# Altium schematic sheet INPUTS_GATES_A.SchDoc
size A4; SheetNumber: 5; SheetTotal: 6
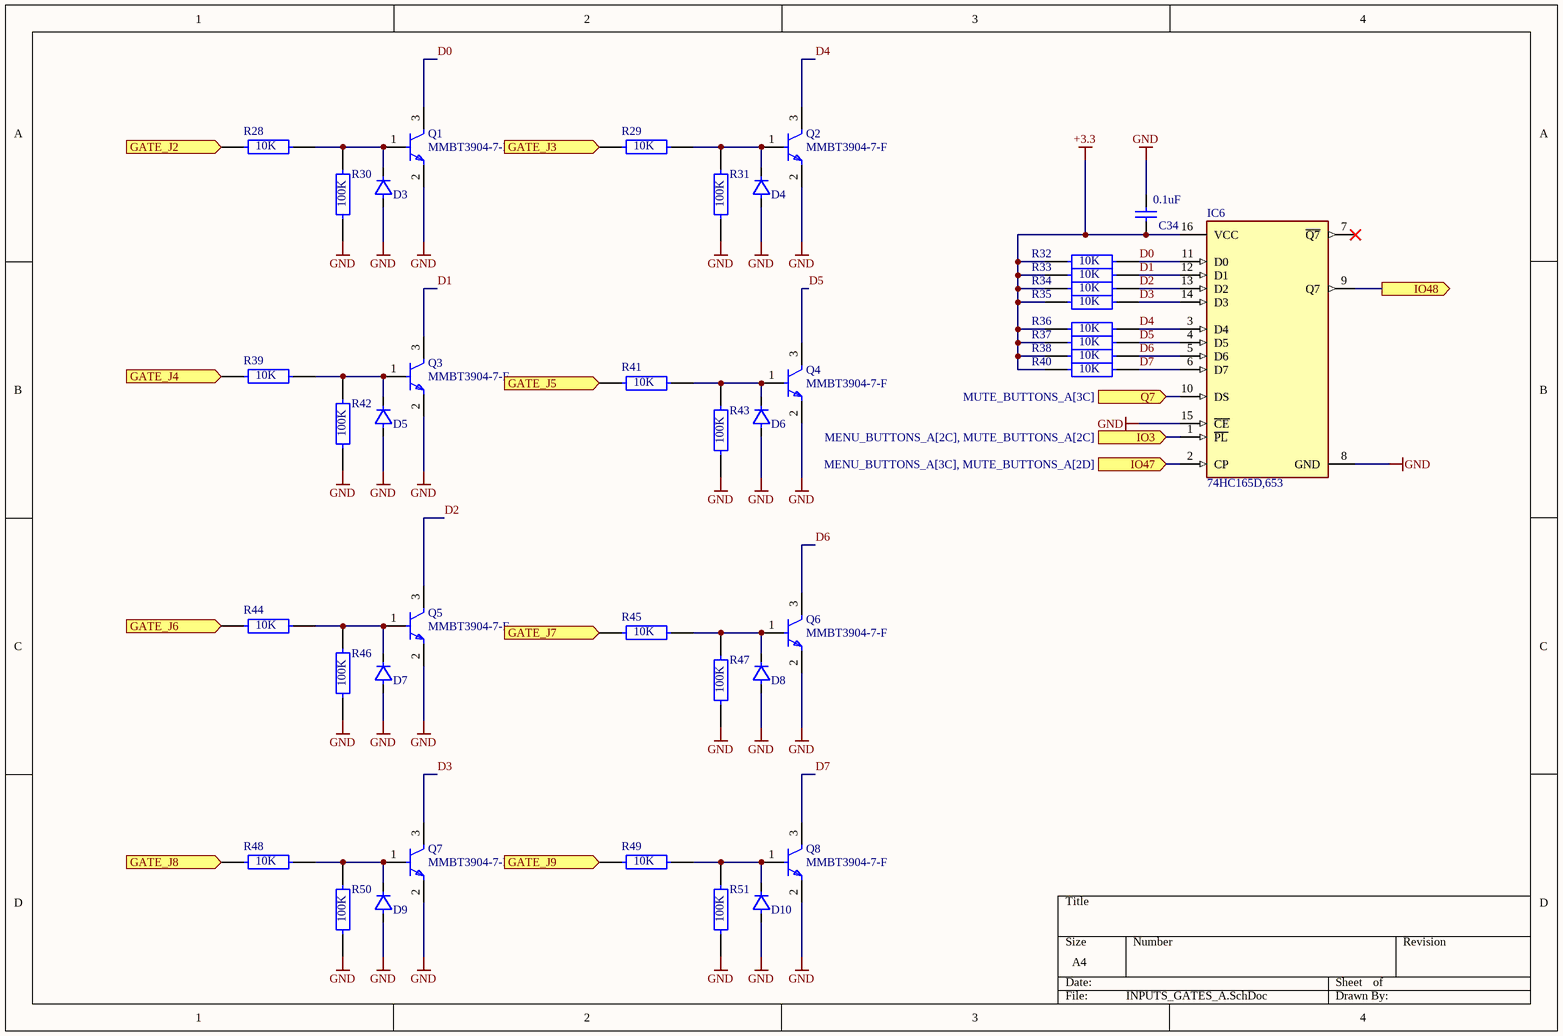
[diagram p0: INPUTS_GATES_A.SchDoc]

## Parts
C34  0.1uF  [CAPC2013X145X48NL20T23]
D3  1N4148WS  [4148]  (value not drawn)
D4  1N4148WS  [4148]  (value not drawn)
D5  1N4148WS  [4148]  (value not drawn)
D6  1N4148WS  [4148]  (value not drawn)
D7  1N4148WS  [4148]  (value not drawn)
D8  1N4148WS  [4148]  (value not drawn)
D9  1N4148WS  [4148]  (value not drawn)
D10  1N4148WS  [4148]  (value not drawn)
IC6  74HC165D,653  [FP-SOT109-1-MFG]
Q1  MMBT3904-7-F  [3904-SOT23]
Q2  MMBT3904-7-F  [3904-SOT23]
Q3  MMBT3904-7-F  [3904-SOT23]
Q4  MMBT3904-7-F  [3904-SOT23]
Q5  MMBT3904-7-F  [3904-SOT23]
Q6  MMBT3904-7-F  [3904-SOT23]
Q7  MMBT3904-7-F  [3904-SOT23]
Q8  MMBT3904-7-F  [3904-SOT23]
R28  10K  [FP-RN73R2A-IPC_A]
R29  10K  [FP-RN73R2A-IPC_A]
R30  100K  [FP-RN73R2A-IPC_A]
R31  100K  [FP-RN73R2A-IPC_A]
R32  10K  [FP-RN73R2A-IPC_A]
R33  10K  [FP-RN73R2A-IPC_A]
R34  10K  [FP-RN73R2A-IPC_A]
R35  10K  [FP-RN73R2A-IPC_A]
R36  10K  [FP-RN73R2A-IPC_A]
R37  10K  [FP-RN73R2A-IPC_A]
R38  10K  [FP-RN73R2A-IPC_A]
R39  10K  [FP-RN73R2A-IPC_A]
R40  10K  [FP-RN73R2A-IPC_A]
R41  10K  [FP-RN73R2A-IPC_A]
R42  100K  [FP-RN73R2A-IPC_A]
R43  100K  [FP-RN73R2A-IPC_A]
R44  10K  [FP-RN73R2A-IPC_A]
R45  10K  [FP-RN73R2A-IPC_A]
R46  100K  [FP-RN73R2A-IPC_A]
R47  100K  [FP-RN73R2A-IPC_A]
R48  10K  [FP-RN73R2A-IPC_A]
R49  10K  [FP-RN73R2A-IPC_A]
R50  100K  [FP-RN73R2A-IPC_A]
R51  100K  [FP-RN73R2A-IPC_A]

## Ports
GATE_J2, GATE_J3, GATE_J4, GATE_J5, GATE_J6, GATE_J7, GATE_J8, GATE_J9, IO3 (in, see MENU_BUTTONS_A[2C], MUTE_BUTTONS_A[2C]), IO47 (in, see MENU_BUTTONS_A[3C], MUTE_BUTTONS_A[2D]), IO48 (out), Q7 (in, see MUTE_BUTTONS_A[3C])

## Nets
+3.3: C34.1 IC6.16(VCC) R32.1 R33.1 R34.1 R35.1 R36.1 R37.1 R38.1 R40.1
GND: C34.2 D3.2(A) D4.2(A) D5.2(A) D6.2(A) D7.2(A) D8.2(A) D9.2(A) D10.2(A) IC6.8(GND) IC6.15(~{CE}) Q1.2(E) Q2.2(E) Q3.2(E) Q4.2(E) Q5.2(E) Q6.2(E) Q7.2(E) Q8.2(E) R30.1 R31.1 R42.1 R43.1 R46.1 R47.1 R50.1 R51.1
D0: IC6.11(D0) Q1.3(C) R32.2
D1: IC6.12(D1) Q3.3(C) R33.2
D2: IC6.13(D2) Q5.3(C) R34.2
D3: IC6.14(D3) Q7.3(C) R35.2
D4: IC6.3(D4) Q2.3(C) R36.2
D5: IC6.4(D5) Q4.3(C) R37.2
D6: IC6.5(D6) Q6.3(C) R38.2
D7: IC6.6(D7) Q8.3(C) R40.2
GATE_J2: R28.1 ; port GATE_J2
GATE_J3: R29.1 ; port GATE_J3
GATE_J4: R39.1 ; port GATE_J4
GATE_J5: R41.1 ; port GATE_J5
GATE_J6: R44.1 ; port GATE_J6
GATE_J7: R45.1 ; port GATE_J7
GATE_J8: R48.1 ; port GATE_J8
GATE_J9: R49.1 ; port GATE_J9
IO3: IC6.1(~{PL}) ; port IO3
IO47: IC6.2(CP) ; port IO47
IO48: IC6.9(Q7) ; port IO48
Q7: IC6.10(DS) ; port Q7
NetD3_1: D3.1(C) Q1.1(B) R28.2 R30.2
NetD4_1: D4.1(C) Q2.1(B) R29.2 R31.2
NetD5_1: D5.1(C) Q3.1(B) R39.2 R42.2
NetD6_1: D6.1(C) Q4.1(B) R41.2 R43.2
NetD7_1: D7.1(C) Q5.1(B) R44.2 R46.2
NetD8_1: D8.1(C) Q6.1(B) R45.2 R47.2
NetD9_1: D9.1(C) Q7.1(B) R48.2 R50.2
NetD10_1: D10.1(C) Q8.1(B) R49.2 R51.2

Not connected (* = marked no-connect by the designer): IC6 7(~{Q7})*

## Library data of the parts
C34 = CAP: Manufacturer: Vitramon; Part Number: VJ0805Y682KXAMT
D3-D10 = 4148WS: DIODE GEN PURP 75V 150MA SOD323F; Forward Voltage: 1V; Power Dissipation: 200mW; Element Configuration: Single; Max Forward Surge Current (Ifsm): 2A; Peak Reverse Current: 5uA; Recovery Time: 4ns; Package Quantity: 1; Number of Pins: 2; Height: 1mm; REACH SVHC: No SVHC; Max Reverse Voltage (DC): 75V; Forward Current: 150mA; Length: 1.8mm; Max Repetitive Reverse Voltage (Vrrm): 75V; Max Operating Temperature: 150°C; Average Rectified Current: 150mA; Contact Plating: Tin; Packaging: Tape and Reel; Radiation Hardening: No; Min Operating Temperature: -55°C; Width: 1.35mm; Weight: 0.0276g; Lead Free: Lead Free; Mount: Surface Mount; Reverse Voltage: 75V; Reverse Recovery Time: 4ns
IC6 = 74HC165: IC SHIFT REGST 8BIT PI-SO 16SOIC; Manufacturer: Nexperia; Standoff Height: 0.1mm; Number Of Inputs: 8; Logic Function Desc: Shift Register; Nominal Supply Current: 8uA; Number Of Circuits: 1; Propagation Delay: 15ns; Min Supply Voltage: 2V; Frequency: 61MHz; Max Supply Voltage: 6V; Height: 1.75mm; Digikey Description: IC SHIFT REGST 8BIT PI-SO 16SOIC; ComponentLink2URL: https://assets.nexperia.com/documents/data-sheet/74HC_HCT165.pdf; Ipc Land Pattern Name: SOP127P600X175-16; Temperature Range High: +125°C; Manufacturer Part Number: 74HC165D,653; Temperature: -40°C to +125°C; Device Class L2: Logic ICs; Device Class L1: Integrated Circuits (ICs); Lead Free: Yes; Number Of Outputs: 1; Ambient Temperature Range High: +125°C; ComponentLink2Description: Datasheet; Temperature Range Low: -40°C; Category: IC; RoHS: TRUE; Automotive: No; Device Class L3: Shift Registers; Octopart: https://octopart.com/74hc165d%2C653-nexperia-78737091; Footprint Url: https://assets.nexperia.com/documents/outline-drawing/SOT109-1.pdf; Ambient Temperature Range Low: -40°C; Package: SOT109-1
Q1-Q8 = 3904: TRANS NPN 40V 0.2A SMD SOT23-3; Frequency: 300MHz; Power Dissipation: 350mW; Element Configuration: Single; Max Power Dissipation: 300mW; Max Collector Current: 200mA; Collector Emitter Saturation Voltage: 300mV; Number of Elements: 1; hFE Min: 100; Collector Base Voltage (VCBO): 60V; Emitter Base Voltage (VEBO): 6V; Contact Plating: Tin; Package Quantity: 3000; Max Frequency: 300MHz; REACH SVHC: No SVHC; Max Operating Temperature: 150°C; Width: 1.4mm; Collector Emitter Voltage (VCEO): 40V; Voltage Rating (DC): 40V; Radiation Hardening: No; Case/Package: SOT-23; Height: 1mm; Collector Emitter Breakdown Voltage: 40V; Length: 3.05mm; Polarity: NPN; Packaging: Tape and Reel; Number of Pins: 3; Min Operating Temperature: -55°C; Gain Bandwidth Product: 300MHz; Mount: Surface Mount; Weight: 0.000282oz; Continuous Collector Current: 200mA; Transition Frequency: 300MHz; Max Breakdown Voltage: 40V; Lead Free: Lead Free
R28-R51 = Resistor: RES 10K OHM 0.1% 1/8W 0805